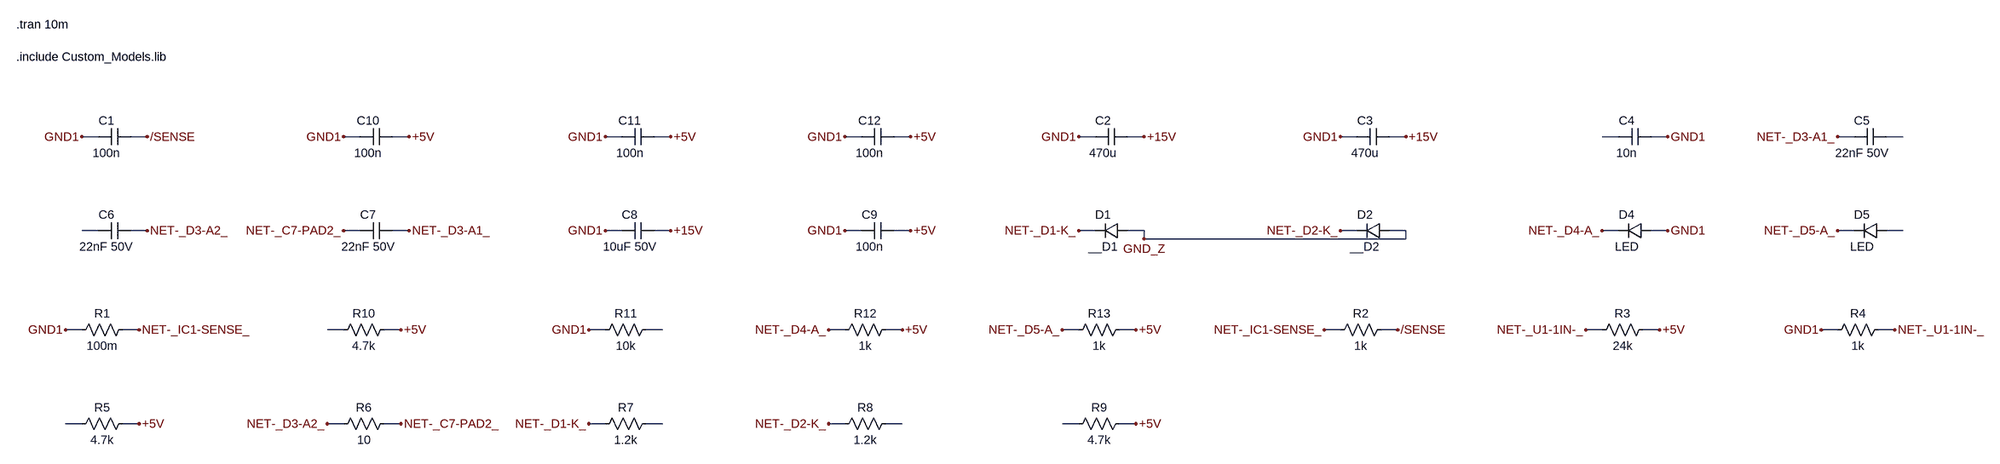
[diagram p0: schematic SYNCHRO_Booster.asc]
SYNCHRO_Booster.asc, the LTspice schematic file:
Version 4
SHEET 1 8000 6000
TEXT 32 32 Left 2 !.tran 10m
TEXT 32 96 Left 2 !.include Custom_Models.lib
SYMBOL cap 256 2576 R90
WINDOW 0 0 48 VBottom 2
WINDOW 3 32 48 VTop 2
SYMATTR InstName C1
SYMATTR Value 100n
SYMBOL cap 768 2576 R90
WINDOW 0 0 48 VBottom 2
WINDOW 3 32 48 VTop 2
SYMATTR InstName C10
SYMATTR Value 100n
SYMBOL cap 1280 2576 R90
WINDOW 0 0 48 VBottom 2
WINDOW 3 32 48 VTop 2
SYMATTR InstName C11
SYMATTR Value 100n
SYMBOL cap 1792 2576 R90
WINDOW 0 0 48 VBottom 2
WINDOW 3 32 48 VTop 2
SYMATTR InstName C12
SYMATTR Value 100n
SYMBOL cap 2304 2576 R90
WINDOW 0 0 48 VBottom 2
WINDOW 3 32 48 VTop 2
SYMATTR InstName C2
SYMATTR Value 470u
SYMBOL cap 2816 2576 R90
WINDOW 0 0 48 VBottom 2
WINDOW 3 32 48 VTop 2
SYMATTR InstName C3
SYMATTR Value 470u
SYMBOL cap 3328 2576 R90
WINDOW 0 0 48 VBottom 2
WINDOW 3 32 48 VTop 2
SYMATTR InstName C4
SYMATTR Value 10n
SYMBOL cap 3840 2576 R90
WINDOW 0 0 48 VBottom 2
WINDOW 3 32 48 VTop 2
SYMATTR InstName C5
SYMATTR Value 22nF 50V
SYMBOL cap 256 2960 R90
WINDOW 0 0 48 VBottom 2
WINDOW 3 32 48 VTop 2
SYMATTR InstName C6
SYMATTR Value 22nF 50V
SYMBOL cap 768 2960 R90
WINDOW 0 0 48 VBottom 2
WINDOW 3 32 48 VTop 2
SYMATTR InstName C7
SYMATTR Value 22nF 50V
SYMBOL cap 1280 2960 R90
WINDOW 0 0 48 VBottom 2
WINDOW 3 32 48 VTop 2
SYMATTR InstName C8
SYMATTR Value 10uF 50V
SYMBOL cap 1792 2960 R90
WINDOW 0 0 48 VBottom 2
WINDOW 3 32 48 VTop 2
SYMATTR InstName C9
SYMATTR Value 100n
SYMBOL diode 2304 2960 R90
WINDOW 0 0 48 VBottom 2
WINDOW 3 32 48 VTop 2
SYMATTR InstName D1
SYMATTR Value __D1
SYMBOL diode 2816 2960 R90
WINDOW 0 0 48 VBottom 2
WINDOW 3 32 48 VTop 2
SYMATTR InstName D2
SYMATTR Value __D2
SYMBOL diode 3328 2960 R90
WINDOW 0 0 48 VBottom 2
WINDOW 3 32 48 VTop 2
SYMATTR InstName D4
SYMATTR Value LED
SYMBOL diode 3840 2960 R90
WINDOW 0 0 48 VBottom 2
WINDOW 3 32 48 VTop 2
SYMATTR InstName D5
SYMATTR Value LED
SYMBOL res 256 3344 R90
WINDOW 0 0 56 VBottom 2
WINDOW 3 32 56 VTop 2
SYMATTR InstName R1
SYMATTR Value 100m
SYMBOL res 768 3344 R90
WINDOW 0 0 56 VBottom 2
WINDOW 3 32 56 VTop 2
SYMATTR InstName R10
SYMATTR Value 4.7k
SYMBOL res 1280 3344 R90
WINDOW 0 0 56 VBottom 2
WINDOW 3 32 56 VTop 2
SYMATTR InstName R11
SYMATTR Value 10k
SYMBOL res 1792 3344 R90
WINDOW 0 0 56 VBottom 2
WINDOW 3 32 56 VTop 2
SYMATTR InstName R12
SYMATTR Value 1k
SYMBOL res 2304 3344 R90
WINDOW 0 0 56 VBottom 2
WINDOW 3 32 56 VTop 2
SYMATTR InstName R13
SYMATTR Value 1k
SYMBOL res 2816 3344 R90
WINDOW 0 0 56 VBottom 2
WINDOW 3 32 56 VTop 2
SYMATTR InstName R2
SYMATTR Value 1k
SYMBOL res 3328 3344 R90
WINDOW 0 0 56 VBottom 2
WINDOW 3 32 56 VTop 2
SYMATTR InstName R3
SYMATTR Value 24k
SYMBOL res 3840 3344 R90
WINDOW 0 0 56 VBottom 2
WINDOW 3 32 56 VTop 2
SYMATTR InstName R4
SYMATTR Value 1k
SYMBOL res 256 3728 R90
WINDOW 0 0 56 VBottom 2
WINDOW 3 32 56 VTop 2
SYMATTR InstName R5
SYMATTR Value 4.7k
SYMBOL res 768 3728 R90
WINDOW 0 0 56 VBottom 2
WINDOW 3 32 56 VTop 2
SYMATTR InstName R6
SYMATTR Value 10
SYMBOL res 1280 3728 R90
WINDOW 0 0 56 VBottom 2
WINDOW 3 32 56 VTop 2
SYMATTR InstName R7
SYMATTR Value 1.2k
SYMBOL res 1792 3728 R90
WINDOW 0 0 56 VBottom 2
WINDOW 3 32 56 VTop 2
SYMATTR InstName R8
SYMATTR Value 1.2k
SYMBOL res 2304 3728 R90
WINDOW 0 0 56 VBottom 2
WINDOW 3 32 56 VTop 2
SYMATTR InstName R9
SYMATTR Value 4.7k
WIRE 256 2592 288 2592
WIRE 192 2592 160 2592
WIRE 768 2592 800 2592
WIRE 704 2592 672 2592
WIRE 1280 2592 1312 2592
WIRE 1216 2592 1184 2592
WIRE 1792 2592 1824 2592
WIRE 1728 2592 1696 2592
WIRE 2304 2592 2336 2592
WIRE 2240 2592 2208 2592
WIRE 2816 2592 2848 2592
WIRE 2752 2592 2720 2592
WIRE 3328 2592 3360 2592
WIRE 3264 2592 3232 2592
WIRE 3840 2592 3872 2592
WIRE 3776 2592 3744 2592
WIRE 256 2976 288 2976
WIRE 192 2976 160 2976
WIRE 768 2976 800 2976
WIRE 704 2976 672 2976
WIRE 1280 2976 1312 2976
WIRE 1216 2976 1184 2976
WIRE 1792 2976 1824 2976
WIRE 1728 2976 1696 2976
WIRE 2304 2976 2336 2976
WIRE 2240 2976 2208 2976
WIRE 2816 2976 2848 2976
WIRE 2752 2976 2720 2976
WIRE 3328 2976 3360 2976
WIRE 3264 2976 3232 2976
WIRE 3840 2976 3872 2976
WIRE 3776 2976 3744 2976
WIRE 240 3360 272 3360
WIRE 160 3360 128 3360
WIRE 752 3360 784 3360
WIRE 672 3360 640 3360
WIRE 1264 3360 1296 3360
WIRE 1184 3360 1152 3360
WIRE 1776 3360 1808 3360
WIRE 1696 3360 1664 3360
WIRE 2288 3360 2320 3360
WIRE 2208 3360 2176 3360
WIRE 2800 3360 2832 3360
WIRE 2720 3360 2688 3360
WIRE 3312 3360 3344 3360
WIRE 3232 3360 3200 3360
WIRE 3824 3360 3856 3360
WIRE 3744 3360 3712 3360
WIRE 240 3744 272 3744
WIRE 160 3744 128 3744
WIRE 752 3744 784 3744
WIRE 672 3744 640 3744
WIRE 1264 3744 1296 3744
WIRE 1184 3744 1152 3744
WIRE 1776 3744 1808 3744
WIRE 1696 3744 1664 3744
WIRE 2288 3744 2320 3744
WIRE 2208 3744 2176 3744
WIRE 2336 2992 2848 2992
WIRE 2336 2976 2336 2992
WIRE 2848 2976 2848 2992
FLAG 288 2592 /SENSE
FLAG 2832 3360 /SENSE
FLAG 160 2592 GND1
FLAG 672 2592 GND1
FLAG 1184 2592 GND1
FLAG 1696 2592 GND1
FLAG 2208 2592 GND1
FLAG 2720 2592 GND1
FLAG 3360 2592 GND1
FLAG 1184 2976 GND1
FLAG 1696 2976 GND1
FLAG 3360 2976 GND1
FLAG 128 3360 GND1
FLAG 1152 3360 GND1
FLAG 3712 3360 GND1
FLAG 800 2592 +5V
FLAG 1312 2592 +5V
FLAG 1824 2592 +5V
FLAG 1824 2976 +5V
FLAG 784 3360 +5V
FLAG 1808 3360 +5V
FLAG 2320 3360 +5V
FLAG 3344 3360 +5V
FLAG 272 3744 +5V
FLAG 2320 3744 +5V
FLAG 2336 2592 +15V
FLAG 2848 2592 +15V
FLAG 1312 2976 +15V
FLAG 3744 2592 NET-_D3-A1_
FLAG 800 2976 NET-_D3-A1_
FLAG 288 2976 NET-_D3-A2_
FLAG 640 3744 NET-_D3-A2_
FLAG 672 2976 NET-_C7-PAD2_
FLAG 784 3744 NET-_C7-PAD2_
FLAG 2336 2992 GND_Z
FLAG 2208 2976 NET-_D1-K_
FLAG 1152 3744 NET-_D1-K_
FLAG 2720 2976 NET-_D2-K_
FLAG 1664 3744 NET-_D2-K_
FLAG 3232 2976 NET-_D4-A_
FLAG 1664 3360 NET-_D4-A_
FLAG 3744 2976 NET-_D5-A_
FLAG 2176 3360 NET-_D5-A_
FLAG 272 3360 NET-_IC1-SENSE_
FLAG 2688 3360 NET-_IC1-SENSE_
FLAG 3200 3360 NET-_U1-1IN-_
FLAG 3856 3360 NET-_U1-1IN-_

The netlist it stands for:
* SYNCHRO_Booster.asc
C1 /SENSE GND1 100n
C10 +5V GND1 100n
C11 +5V GND1 100n
C12 +5V GND1 100n
C2 +15V GND1 470u
C3 +15V GND1 470u
C4 GND1 N001 10n
C5 N002 NET-_D3-A1_ 22nF 50V
C6 NET-_D3-A2_ N003 22nF 50V
C7 NET-_D3-A1_ NET-_C7-PAD2_ 22nF 50V
C8 +15V GND1 10uF 50V
C9 +5V GND1 100n
D1 GND_Z NET-_D1-K_ __D1
D2 GND_Z NET-_D2-K_ __D2
D4 GND1 NET-_D4-A_ LED
D5 N004 NET-_D5-A_ LED
R1 NET-_IC1-SENSE_ GND1 100m
R10 +5V N005 4.7k
R11 N006 GND1 10k
R12 +5V NET-_D4-A_ 1k
R13 +5V NET-_D5-A_ 1k
R2 /SENSE NET-_IC1-SENSE_ 1k
R3 +5V NET-_U1-1IN-_ 24k
R4 NET-_U1-1IN-_ GND1 1k
R5 +5V N007 4.7k
R6 NET-_C7-PAD2_ NET-_D3-A2_ 10
R7 N008 NET-_D1-K_ 1.2k
R8 N009 NET-_D2-K_ 1.2k
R9 +5V N010 4.7k
.model D D
.lib standard.dio
.tran 10m
.include Custom_Models.lib
.backanno
.end